# Altium schematic sheet GD.SchDoc
size B; SheetNumber: 2; SheetTotal: 2
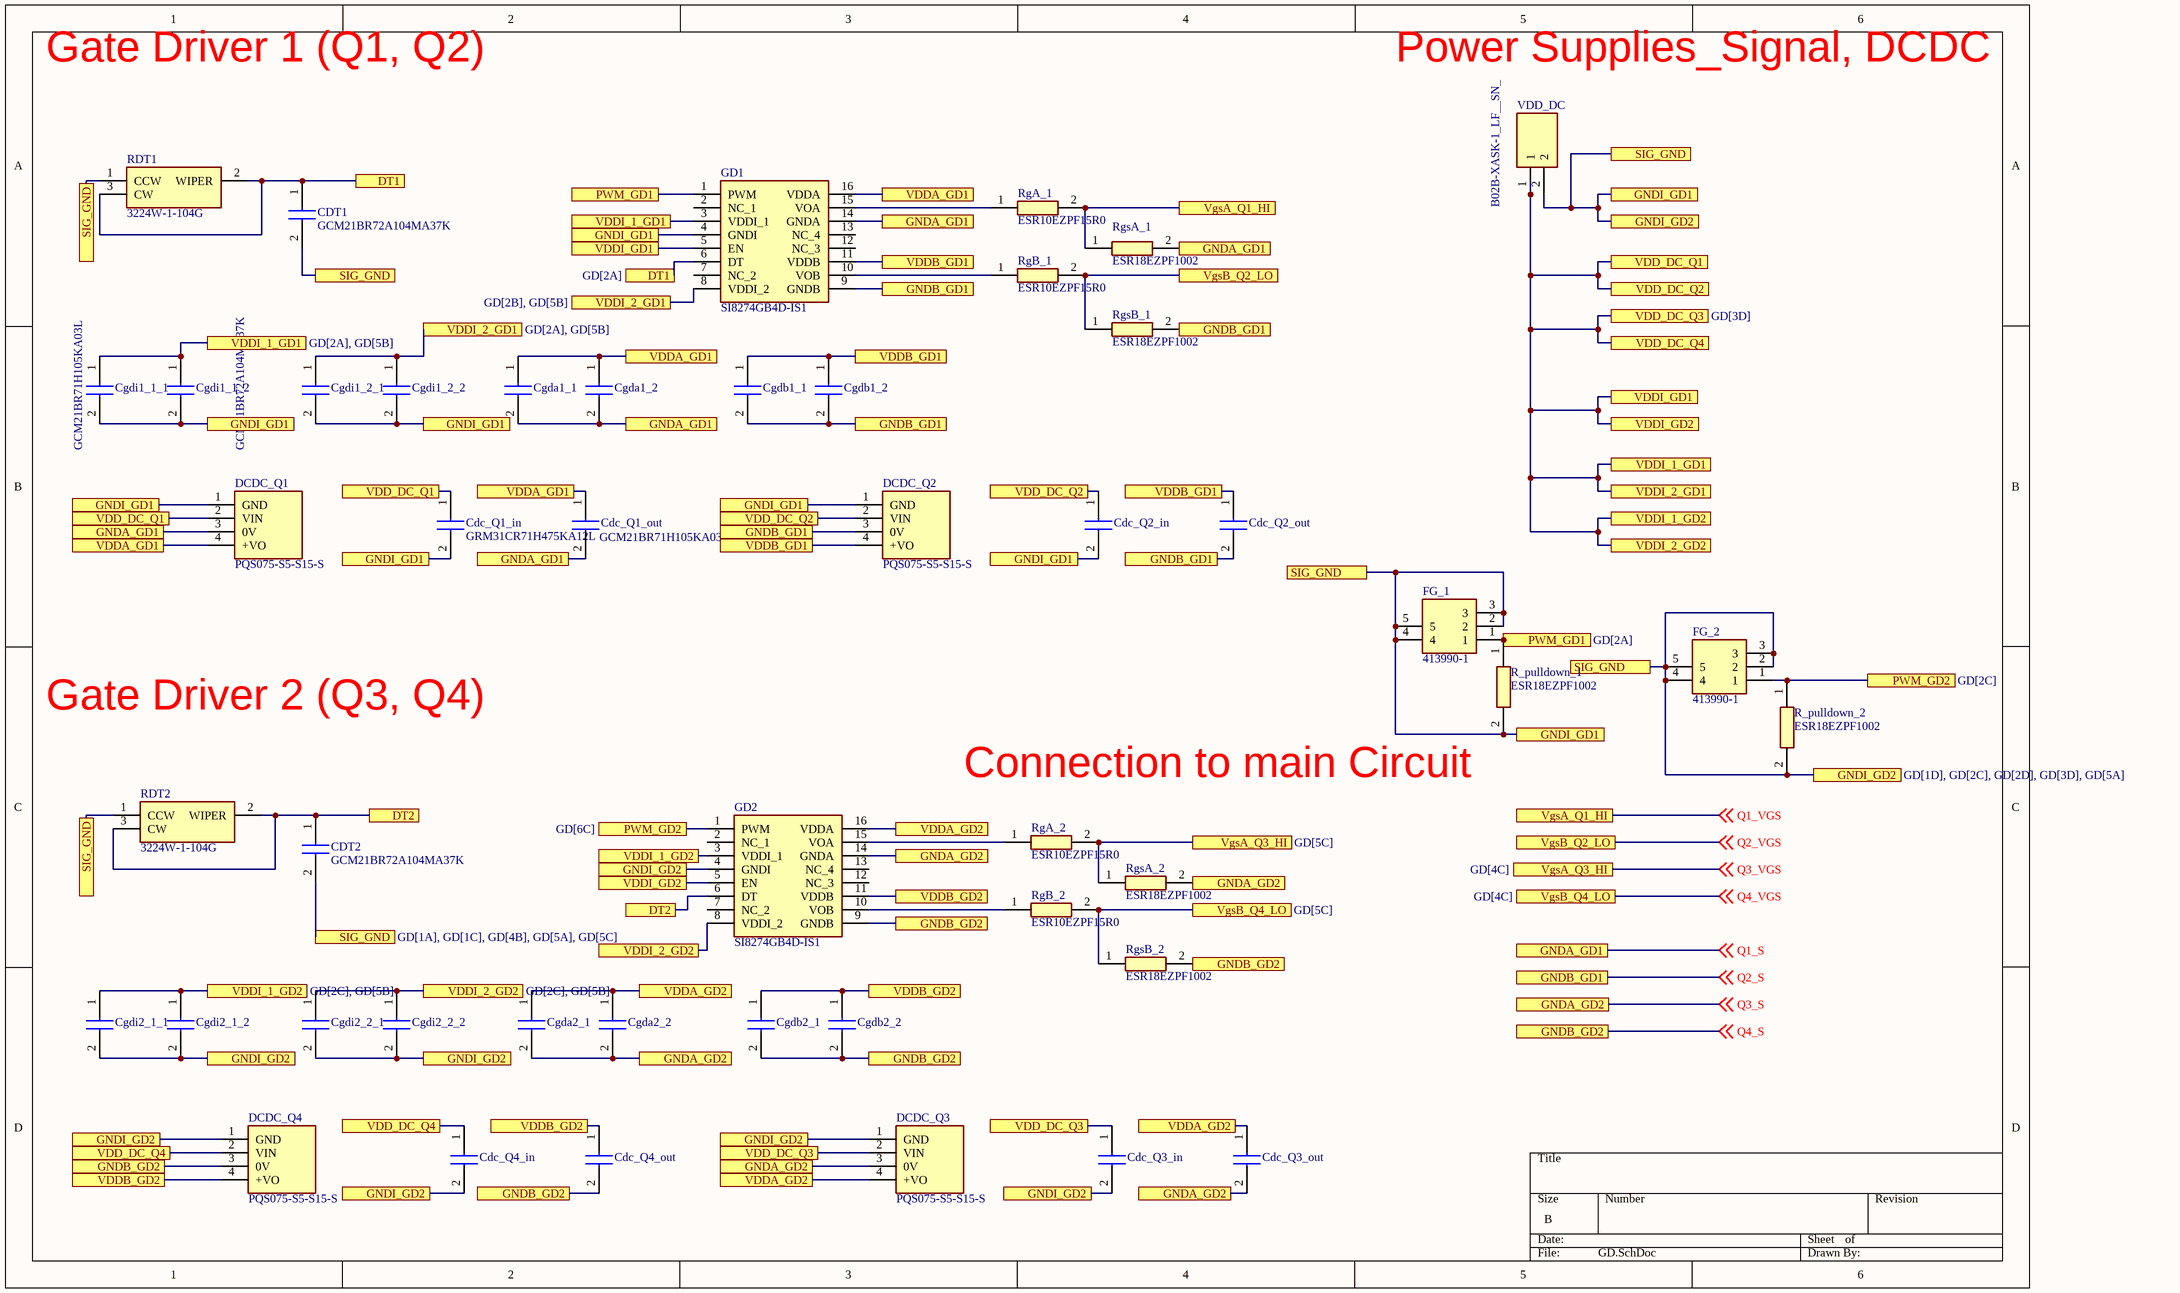
[diagram p0: GD.SchDoc]

## Parts
Cdc_Q1_in  GRM31CR71H475KA12L  [CAPC3216X180N]
Cdc_Q1_out  GCM21BR71H105KA03L  [CAPC2012X140N]
Cdc_Q2_in  GRM31CR71H475KA12L  [CAPC3216X180N]  (value not drawn)
Cdc_Q2_out  GCM21BR71H105KA03L  [CAPC2012X140N]  (value not drawn)
Cdc_Q3_in  GRM31CR71H475KA12L  [CAPC3216X180N]  (value not drawn)
Cdc_Q3_out  GCM21BR71H105KA03L  [CAPC2012X140N]  (value not drawn)
Cdc_Q4_in  GRM31CR71H475KA12L  [CAPC3216X180N]  (value not drawn)
Cdc_Q4_out  GCM21BR71H105KA03L  [CAPC2012X140N]  (value not drawn)
CDT1  GCM21BR72A104MA37K  [GCM21]
CDT2  GCM21BR72A104MA37K  [GCM21]
Cgda1_1  GCM21BR71H105KA03L  [CAPC2012X140N]  (value not drawn)
Cgda1_2  GCM21BR72A104MA37K  [GCM21]  (value not drawn)
Cgda2_1  GCM21BR71H105KA03L  [CAPC2012X140N]  (value not drawn)
Cgda2_2  GCM21BR72A104MA37K  [GCM21]  (value not drawn)
Cgdb1_1  GCM21BR71H105KA03L  [CAPC2012X140N]  (value not drawn)
Cgdb1_2  GCM21BR72A104MA37K  [GCM21]  (value not drawn)
Cgdb2_1  GCM21BR71H105KA03L  [CAPC2012X140N]  (value not drawn)
Cgdb2_2  GCM21BR72A104MA37K  [GCM21]  (value not drawn)
Cgdi1_1_1  GCM21BR71H105KA03L  [CAPC2012X140N]
Cgdi1_1_2  GCM21BR72A104MA37K  [GCM21]
Cgdi1_2_1  GCM21BR71H105KA03L  [CAPC2012X140N]  (value not drawn)
Cgdi1_2_2  GCM21BR72A104MA37K  [GCM21]  (value not drawn)
Cgdi2_1_1  GCM21BR71H105KA03L  [CAPC2012X140N]  (value not drawn)
Cgdi2_1_2  GCM21BR72A104MA37K  [GCM21]  (value not drawn)
Cgdi2_2_1  GCM21BR71H105KA03L  [CAPC2012X140N]  (value not drawn)
Cgdi2_2_2  GCM21BR72A104MA37K  [GCM21]  (value not drawn)
DCDC_Q1  PQS075-S5-S15-S  [PQS075S5S15S]
DCDC_Q2  PQS075-S5-S15-S  [PQS075S5S15S]
DCDC_Q3  PQS075-S5-S15-S  [PQS075S5S15S]
DCDC_Q4  PQS075-S5-S15-S  [PQS075S5S15S]
FG_1  413990-1  [4139901]
FG_2  413990-1  [4139901]
GD1  SI8274GB4D-IS1  [SOIC127P600X175-16N]
GD2  SI8274GB4D-IS1  [SOIC127P600X175-16N]
R_pulldown_1  ESR18EZPF1002  [RESC3216X65N]
R_pulldown_2  ESR18EZPF1002  [RESC3216X65N]
RDT1  3224W-1-104G  [3224W1104G]
RDT2  3224W-1-104G  [3224W1104G]
RgA_1  ESR10EZPF15R0  [RESC2012X65N]
RgA_2  ESR10EZPF15R0  [RESC2012X65N]
RgB_1  ESR10EZPF15R0  [RESC2012X65N]
RgB_2  ESR10EZPF15R0  [RESC2012X65N]
RgsA_1  ESR18EZPF1002  [RESC3216X65N]
RgsA_2  ESR18EZPF1002  [RESC3216X65N]
RgsB_1  ESR18EZPF1002  [RESC3216X65N]
RgsB_2  ESR18EZPF1002  [RESC3216X65N]
VDD_DC  B02B-XASK-1_LF__SN_  [SHDR2W60P0X250_1X2_750X640X880P]

## Ports
DT1 (see GD[2A]), DT2 (see GD[2C]), GNDA_GD1 (see GD[1B], GD[2B], GD[3A], GD[4A]), GNDA_GD1 (see GD[1B], GD[2B], GD[3A], GD[4A], GD[5C]), GNDA_GD1 (see GD[1B], GD[2B], GD[3A], GD[5C]), GNDA_GD1 (see GD[1B], GD[2B], GD[4A], GD[5C]), GNDA_GD1 (see GD[2B], GD[3A], GD[4A], GD[5C]), GNDA_GD2 (see GD[2D], GD[3C], GD[3D], GD[4C], GD[4D]), GNDA_GD2 (see GD[2D], GD[3C], GD[3D], GD[4C], GD[5D]), GNDA_GD2 (see GD[2D], GD[3C], GD[3D], GD[4D], GD[5D]), GNDA_GD2 (see GD[2D], GD[3C], GD[4C], GD[4D], GD[5D]), GNDA_GD2 (see GD[2D], GD[3D], GD[4C], GD[4D], GD[5D]), GNDA_GD2 (see GD[3C], GD[3D], GD[4C], GD[4D], GD[5D]), GNDB_GD1 (see GD[3A], GD[3B], GD[4B]), GNDB_GD1 (see GD[3A], GD[3B], GD[4B], GD[5D]), GNDB_GD1 (see GD[3B], GD[4B], GD[5D]), GNDB_GD2 (see GD[1D], GD[2D], GD[3C], GD[3D], GD[4C]), GNDB_GD2 (see GD[1D], GD[2D], GD[3C], GD[3D], GD[5D]), GNDB_GD2 (see GD[1D], GD[2D], GD[3C], GD[4C], GD[5D]), GNDB_GD2 (see GD[1D], GD[2D], GD[3D], GD[4C], GD[5D]), GNDB_GD2 (see GD[1D], GD[3C], GD[3D], GD[4C], GD[5D]), GNDB_GD2 (see GD[2D], GD[3C], GD[3D], GD[4C], GD[5D]), GNDI_GD1 (see GD[1B], GD[2A], GD[2B], GD[3B], GD[5A]), GNDI_GD1 (see GD[1B], GD[2A], GD[2B], GD[3B], GD[5A], GD[5C]), GNDI_GD1 (see GD[1B], GD[2A], GD[2B], GD[3B], GD[5C]), GNDI_GD1 (see GD[1B], GD[2B], GD[3B], GD[5A], GD[5C]), GNDI_GD2 (see GD[1D], GD[2C], GD[2D], GD[3D], GD[5A]), GNDI_GD2 (see GD[1D], GD[2C], GD[2D], GD[3D], GD[5A], GD[6C]), GNDI_GD2 (see GD[1D], GD[2C], GD[2D], GD[3D], GD[6C]), GNDI_GD2 (see GD[1D], GD[2D], GD[3D], GD[5A], GD[6C]), PWM_GD1 (see GD[2A]), PWM_GD1 (see GD[5B]), PWM_GD2 (see GD[2C]), PWM_GD2 (see GD[6C]), SIG_GND (see GD[1A], GD[1C], GD[4B], GD[5A]), SIG_GND (see GD[1A], GD[1C], GD[4B], GD[5A], GD[5C]), SIG_GND (see GD[1A], GD[1C], GD[4B], GD[5C]), SIG_GND (see GD[1A], GD[1C], GD[5A], GD[5C]), VDD_DC_Q1 (see GD[1B], GD[2B]), VDD_DC_Q1 (see GD[1B], GD[5A]), VDD_DC_Q1 (see GD[2B], GD[5A]), VDD_DC_Q2 (see GD[3B]), VDD_DC_Q2 (see GD[3B], GD[5A]), VDD_DC_Q3 (see GD[3D]), VDD_DC_Q3 (see GD[3D], GD[5A]), VDD_DC_Q4 (see GD[1D]), VDD_DC_Q4 (see GD[1D], GD[5B]), VDDA_GD1 (see GD[1B], GD[2B]), VDDA_GD1 (see GD[1B], GD[2B], GD[3A]), VDDA_GD1 (see GD[2B], GD[3A]), VDDA_GD2 (see GD[2D], GD[3C], GD[3D]), VDDA_GD2 (see GD[2D], GD[3C], GD[4D]), VDDA_GD2 (see GD[2D], GD[3D], GD[4D]), VDDA_GD2 (see GD[3C], GD[3D], GD[4D]), VDDB_GD1 (see GD[3A], GD[3B]), VDDB_GD1 (see GD[3A], GD[3B], GD[4B]), VDDB_GD1 (see GD[3B], GD[4B]), VDDB_GD2 (see GD[1D], GD[2D], GD[3C]), VDDB_GD2 (see GD[1D], GD[2D], GD[3D]), VDDB_GD2 (see GD[1D], GD[3C], GD[3D]), VDDB_GD2 (see GD[2D], GD[3C], GD[3D]), VDDI_1_GD1 (see GD[1B], GD[2A]), VDDI_1_GD1 (see GD[1B], GD[5B]), VDDI_1_GD1 (see GD[2A], GD[5B]), VDDI_1_GD2 (see GD[1D], GD[2C]), VDDI_1_GD2 (see GD[1D], GD[5B]), VDDI_1_GD2 (see GD[2C], GD[5B]), VDDI_2_GD1 (see GD[2A], GD[2B]), VDDI_2_GD1 (see GD[2A], GD[5B]), VDDI_2_GD1 (see GD[2B], GD[5B]), VDDI_2_GD2 (see GD[2C], GD[2D]), VDDI_2_GD2 (see GD[2C], GD[5B]), VDDI_2_GD2 (see GD[2D], GD[5B]), VDDI_GD1 (see GD[2A]), VDDI_GD1 (see GD[5B]), VDDI_GD2 (see GD[2C]), VDDI_GD2 (see GD[5B]), VgsA_Q1_HI (see GD[4A]), VgsA_Q1_HI (see GD[5C]), VgsA_Q3_HI (see GD[4C]), VgsA_Q3_HI (see GD[5C]), VgsB_Q2_LO (see GD[4A]), VgsB_Q2_LO (see GD[5C]), VgsB_Q4_LO (see GD[4C]), VgsB_Q4_LO (see GD[5C])

## Nets
DT1: CDT1.1 GD1.6(DT) RDT1.2(WIPER) RDT1.3(CW) ; port DT1
DT2: CDT2.1 GD2.6(DT) RDT2.2(WIPER) RDT2.3(CW) ; port DT2
GNDI_GD1: Cdc_Q1_in.2 Cdc_Q2_in.2 Cdc_Q3_in.2 Cdc_Q4_in.2 CDT1.2 CDT2.2 Cgdi1_1_1.2 Cgdi1_1_2.2 Cgdi1_2_1.2 Cgdi1_2_2.2 Cgdi2_1_1.2 Cgdi2_1_2.2 Cgdi2_2_1.2 Cgdi2_2_2.2 DCDC_Q1.1(GND) DCDC_Q2.1(GND) DCDC_Q3.1(GND) DCDC_Q4.1(GND) FG_1.2 FG_1.3 FG_1.4 FG_1.5 FG_2.2 FG_2.3 FG_2.4 FG_2.5 GD1.4(GNDI) GD2.4(GNDI) R_pulldown_1.2 R_pulldown_2.2 RDT1.1(CCW) RDT2.1(CCW) VDD_DC.2 ; port GNDI_GD1, port GNDI_GD2, port SIG_GND
PWM_GD1: FG_1.1 GD1.1(PWM) R_pulldown_1.1 ; port PWM_GD1
PWM_GD2: FG_2.1 GD2.1(PWM) R_pulldown_2.1 ; port PWM_GD2
Q1_S: Cdc_Q1_out.2 Cgda1_1.2 Cgda1_2.2 DCDC_Q1.3(0V) GD1.14(GNDA) RgsA_1.2 ; off-sheet Q1_S, port GNDA_GD1
Q1_VGS: RgA_1.2 RgsA_1.1 ; off-sheet Q1_VGS, port VgsA_Q1_HI
Q2_S: Cdc_Q2_out.2 Cgdb1_1.2 Cgdb1_2.2 DCDC_Q2.3(0V) GD1.9(GNDB) RgsB_1.2 ; off-sheet Q2_S, port GNDB_GD1
Q2_VGS: RgB_1.2 RgsB_1.1 ; off-sheet Q2_VGS, port VgsB_Q2_LO
Q3_S: Cdc_Q3_out.2 Cgda2_1.2 Cgda2_2.2 DCDC_Q3.3(0V) GD2.14(GNDA) RgsA_2.2 ; off-sheet Q3_S, port GNDA_GD2
Q3_VGS: RgA_2.2 RgsA_2.1 ; off-sheet Q3_VGS, port VgsA_Q3_HI
Q4_S: Cdc_Q4_out.2 Cgdb2_1.2 Cgdb2_2.2 DCDC_Q4.3(0V) GD2.9(GNDB) RgsB_2.2 ; off-sheet Q4_S, port GNDB_GD2
Q4_VGS: RgB_2.2 RgsB_2.1 ; off-sheet Q4_VGS, port VgsB_Q4_LO
VDD_DC_Q1: Cdc_Q1_in.1 Cdc_Q2_in.1 Cdc_Q3_in.1 Cdc_Q4_in.1 Cgdi1_1_1.1 Cgdi1_1_2.1 Cgdi1_2_1.1 Cgdi1_2_2.1 Cgdi2_1_1.1 Cgdi2_1_2.1 Cgdi2_2_1.1 Cgdi2_2_2.1 DCDC_Q1.2(VIN) DCDC_Q2.2(VIN) DCDC_Q3.2(VIN) DCDC_Q4.2(VIN) GD1.3(VDDI_1) GD1.5(EN) GD1.8(VDDI_2) GD2.3(VDDI_1) GD2.5(EN) GD2.8(VDDI_2) VDD_DC.1 ; port VDDI_GD1, port VDDI_GD2, port VDDI_1_GD1, port VDD_DC_Q1, port VDD_DC_Q2, port VDD_DC_Q3, port VDD_DC_Q4, port VDDI_1_GD2, port VDDI_2_GD1, port VDDI_2_GD2
VDDA_GD1: Cdc_Q1_out.1 Cgda1_1.1 Cgda1_2.1 DCDC_Q1.4(+VO) GD1.16(VDDA) ; port VDDA_GD1
VDDA_GD2: Cdc_Q3_out.1 Cgda2_1.1 Cgda2_2.1 DCDC_Q3.4(+VO) GD2.16(VDDA) ; port VDDA_GD2
VDDB_GD1: Cdc_Q2_out.1 Cgdb1_1.1 Cgdb1_2.1 DCDC_Q2.4(+VO) GD1.11(VDDB) ; port VDDB_GD1
VDDB_GD2: Cdc_Q4_out.1 Cgdb2_1.1 Cgdb2_2.1 DCDC_Q4.4(+VO) GD2.11(VDDB) ; port VDDB_GD2
NetGD1_10: GD1.10(VOB) RgB_1.1
NetGD1_15: GD1.15(VOA) RgA_1.1
NetGD2_10: GD2.10(VOB) RgB_2.1
NetGD2_15: GD2.15(VOA) RgA_2.1

Not connected (* = marked no-connect by the designer): GD1 2(NC_1) 7(NC_2) 12(NC_3) 13(NC_4); GD2 2(NC_1) 7(NC_2) 12(NC_3) 13(NC_4)

## Notes on the sheet
- Gate Driver 1 (Q1, Q2)
- Power Supplies_Signal, DCDC
- Gate Driver 2 (Q3, Q4)
- (near R_pulldown_1) Connection to main Circuit

## Library data of the parts
Cdc_Q1_in Cdc_Q2_in Cdc_Q3_in Cdc_Q4_in = GRM31CR71H475KA12L: Capacitor; Manufacturer_Name: Murata Electronics; Datasheet Link: https://search.murata.co.jp/Ceramy/image/img/A01X/G101/ENG/GRM31CR71H475KA12-01A.pdf; Height: 1.8mm; Manufacturer_Part_Number: GRM31CR71H475KA12L; Mouser Part Number: 81-GRM31CR71H475KA2L; Mouser Price/Stock: https://www.mouser.co.uk/ProductDetail/Murata-Electronics/GRM31CR71H475KA12L?qs=QOxk%252BkhTc6I%252BVQUsJuOHog%3D%3D; Arrow Part Number: GRM31CR71H475KA12L; Arrow Price/Stock: https://www.arrow.com/en/products/grm31cr71h475ka12l/murata-manufacturing?utm_currency=USD&region=nac
Cdc_Q1_out Cdc_Q2_out Cdc_Q3_out Cdc_Q4_out Cgda1_1 Cgda2_1 Cgdb1_1 Cgdb2_1 Cgdi1_1_1 Cgdi1_2_1 Cgdi2_1_1 Cgdi2_2_1 = GCM21BR71H105KA03L: Capacitor; Manufacturer_Name: Murata Electronics; Datasheet Link: https://search.murata.co.jp/Ceramy/image/img/A01X/G101/ENG/GCM21BR71H105KA03-01A.pdf; Height: 1.4mm; Manufacturer_Part_Number: GCM21BR71H105KA03L; Mouser Part Number: 81-GCM21BR71H105KA3L; Mouser Price/Stock: https://www.mouser.co.uk/ProductDetail/Murata-Electronics/GCM21BR71H105KA03L?qs=74rrZF77WIzs3UJkpPZdKw%3D%3D; Arrow Part Number: GCM21BR71H105KA03L; Arrow Price/Stock: https://www.arrow.com/en/products/gcm21br71h105ka03l/murata-manufacturing?utm_currency=USD&region=nac
CDT1 CDT2 Cgda1_2 Cgda2_2 Cgdb1_2 Cgdb2_2 Cgdi1_1_2 Cgdi1_2_2 Cgdi2_1_2 Cgdi2_2_2 = GCM21BR72A104MA37K: Capacitor; Manufacturer_Name: Murata Electronics; Datasheet Link: https://search.murata.co.jp/Ceramy/image/img/A01X/G101/ENG/GCM21BR72A104MA37-01A.pdf; Height: 1.4mm; Manufacturer_Part_Number: GCM21BR72A104MA37K
DCDC_Q1-DCDC_Q4 = PQS075-S5-S15-S: Integrated Circuit; Manufacturer_Name: CUI Inc.; Datasheet Link: https://www.cui.com/product/resource/pdf/pqs075-s.pdf; Height: 10.41mm; Manufacturer_Part_Number: PQS075-S5-S15-S; Mouser Part Number: 490-PQS075-S5-S15-S; Mouser Price/Stock: https://www.mouser.co.uk/ProductDetail/CUI-Inc/PQS075-S5-S15-S/?qs=26oI9%252Bq63sIfifa58tSGNg%3D%3D
FG_1 FG_2 = 413990-1: Connector; Manufacturer_Name: TE Connectivity; Datasheet Link: https://www.te.com/commerce/DocumentDelivery/DDEController?Action=srchrtrv&DocNm=1307191_SMB_Connectors&DocType=Catalog%20Section&DocLang=English&PartCntxt=413990-1&DocFormat=pdf; Height: 7.62mm; Manufacturer_Part_Number: 413990-1; Mouser Part Number: 571-4139901; Mouser Price/Stock: https://www.mouser.co.uk/ProductDetail/TE-Connectivity/413990-1?qs=7QuPeZUaY4GhWa7hqv5PMQ%3D%3D; Arrow Part Number: 413990-1; Arrow Price/Stock: https://www.arrow.com/en/products/413990-1/te-connectivity?region=europe
GD1 GD2 = SI8274GB4D-IS1: Integrated Circuit; Manufacturer_Name: Skyworks; Datasheet Link: https://www.skyworksinc.com/-/media/Skyworks/SL/documents/public/data-sheets/Si827x.pdf; Height: 1.75mm; Manufacturer_Part_Number: SI8274GB4D-IS1; Mouser Part Number: 634-SI8274GB4D-IS1; Mouser Price/Stock: https://www.mouser.co.uk/ProductDetail/Skyworks-Solutions-Inc/SI8274GB4D-IS1?qs=j6MGy4L9yX3Ou%2FIj7aSdKQ%3D%3D
R_pulldown_1 R_pulldown_2 RgsA_1 RgsA_2 RgsB_1 RgsB_2 = ESR18EZPF1002: Resistor; Manufacturer_Name: ROHM Semiconductor; Datasheet Link: https://datasheet.datasheetarchive.com/originals/distributors/Datasheets_SAMA/30ccb516c688c96e56c83a00b77a93f4.pdf; Height: 0.65mm; Manufacturer_Part_Number: ESR18EZPF1002; Mouser Part Number: 755-ESR18EZPF1002; Mouser Price/Stock: https://www.mouser.com/Search/Refine.aspx?Keyword=755-ESR18EZPF1002; Arrow Part Number: ESR18EZPF1002; Arrow Price/Stock: https://www.arrow.com/en/products/esr18ezpf1002/rohm-semiconductor
RDT1 RDT2 = 3224W-1-104G: Variable Resistor; Manufacturer_Name: Bourns; Datasheet Link: https://www.bourns.com/docs/product-datasheets/3224.pdf?sfvrsn=c872982f_10; Height: 5.55mm; Manufacturer_Part_Number: 3224W-1-104G; Mouser Part Number: 652-3224W-1-104G; Mouser Price/Stock: https://www.mouser.co.uk/ProductDetail/Bourns/3224W-1-104G?qs=tEaODSGlU8NOeIAULE3a4g%3D%3D; Arrow Part Number: 3224W-1-104G; Arrow Price/Stock: https://www.arrow.com/en/products/3224w-1-104g/bourns
RgA_1 RgA_2 RgB_1 RgB_2 = ESR10EZPF15R0: Resistor; Manufacturer_Name: ROHM Semiconductor; Datasheet Link: https://fscdn.rohm.com/en/products/databook/datasheet/passive/resistor/chip_resistor/esr-e.pdf; Height: 0.65mm; Manufacturer_Part_Number: ESR10EZPF15R0; Mouser Part Number: 755-ESR10EZPF15R0; Mouser Price/Stock: https://www.mouser.co.uk/ProductDetail/ROHM-Semiconductor/ESR10EZPF15R0?qs=DyUWGjl%252BcVuuTlFPYREySw%3D%3D
VDD_DC = B02B-XASK-1_LF__SN_: Connector; Manufacturer_Name: JST (JAPAN SOLDERLESS TERMINALS); Manufacturer_Part_Number: B02B-XASK-1(LF)(SN); Datasheet Link: http://www.jst-mfg.com/product/pdf/eng/eXA1.pdf; Height: 8.8mm; Mouser Part Number: N/A; Mouser Price/Stock: https://www.mouser.co.uk/ProductDetail/JST-Commercial/B02B-XASK-1LFSN?qs=IKkN%2F947nfBty2GocXf7QA%3D%3D; Arrow Part Number: B02B-XASK-1(LF)(SN); Arrow Price/Stock: https://www.arrow.com/en/products/b02b-xask-1-lf-sn/jst-manufacturing?utm_currency=USD&region=europe